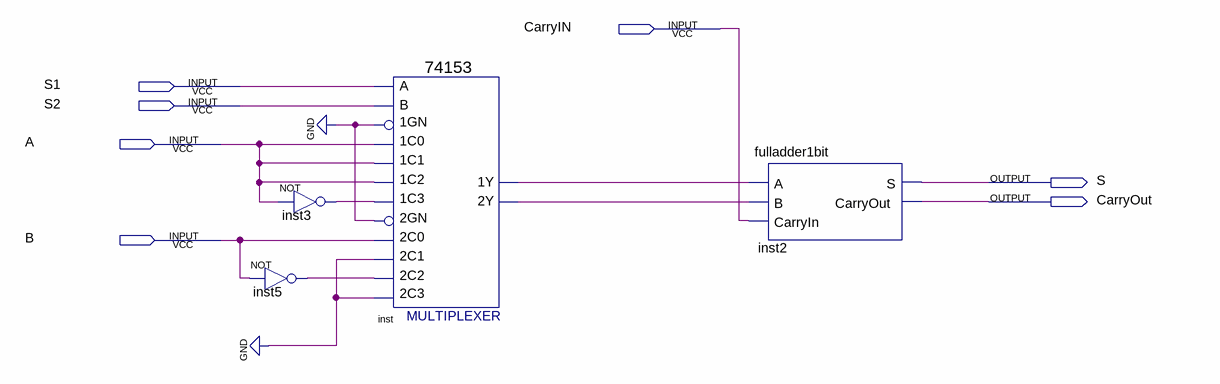
[diagram p0: schematic sheet]
// Quartus schematic arithcircuit1bit.bdf as structural Verilog: 4 symbols, 7 pins
module arithcircuit1bit (
  input  CarryIN,
  input  S1,
  input  S2,
  input  A,
  input  B,
  output S,
  output CarryOut
);

  wire inst3_out, inst5_out, inst_1y, inst_2y;

  not inst3 (inst3_out, A);
  not inst5 (inst5_out, B);
  \74153  inst (
    .\1C1 (A), .\1GN (1'b0), .\1C0 (A), .\2C0 (B), .\2GN (1'b0), .\2C2 (inst5_out), .\1C2 (A),
    .\1C3 (inst3_out), .B(S2), .A(S1), .\2C1 (1'b0), .\2C3 (1'b0), .\1Y (inst_1y), .\2Y (inst_2y));
  fulladder1bit inst2 (.A(inst_1y), .B(inst_2y), .CarryIn(CarryIN), .S(S), .CarryOut(CarryOut));
endmodule
